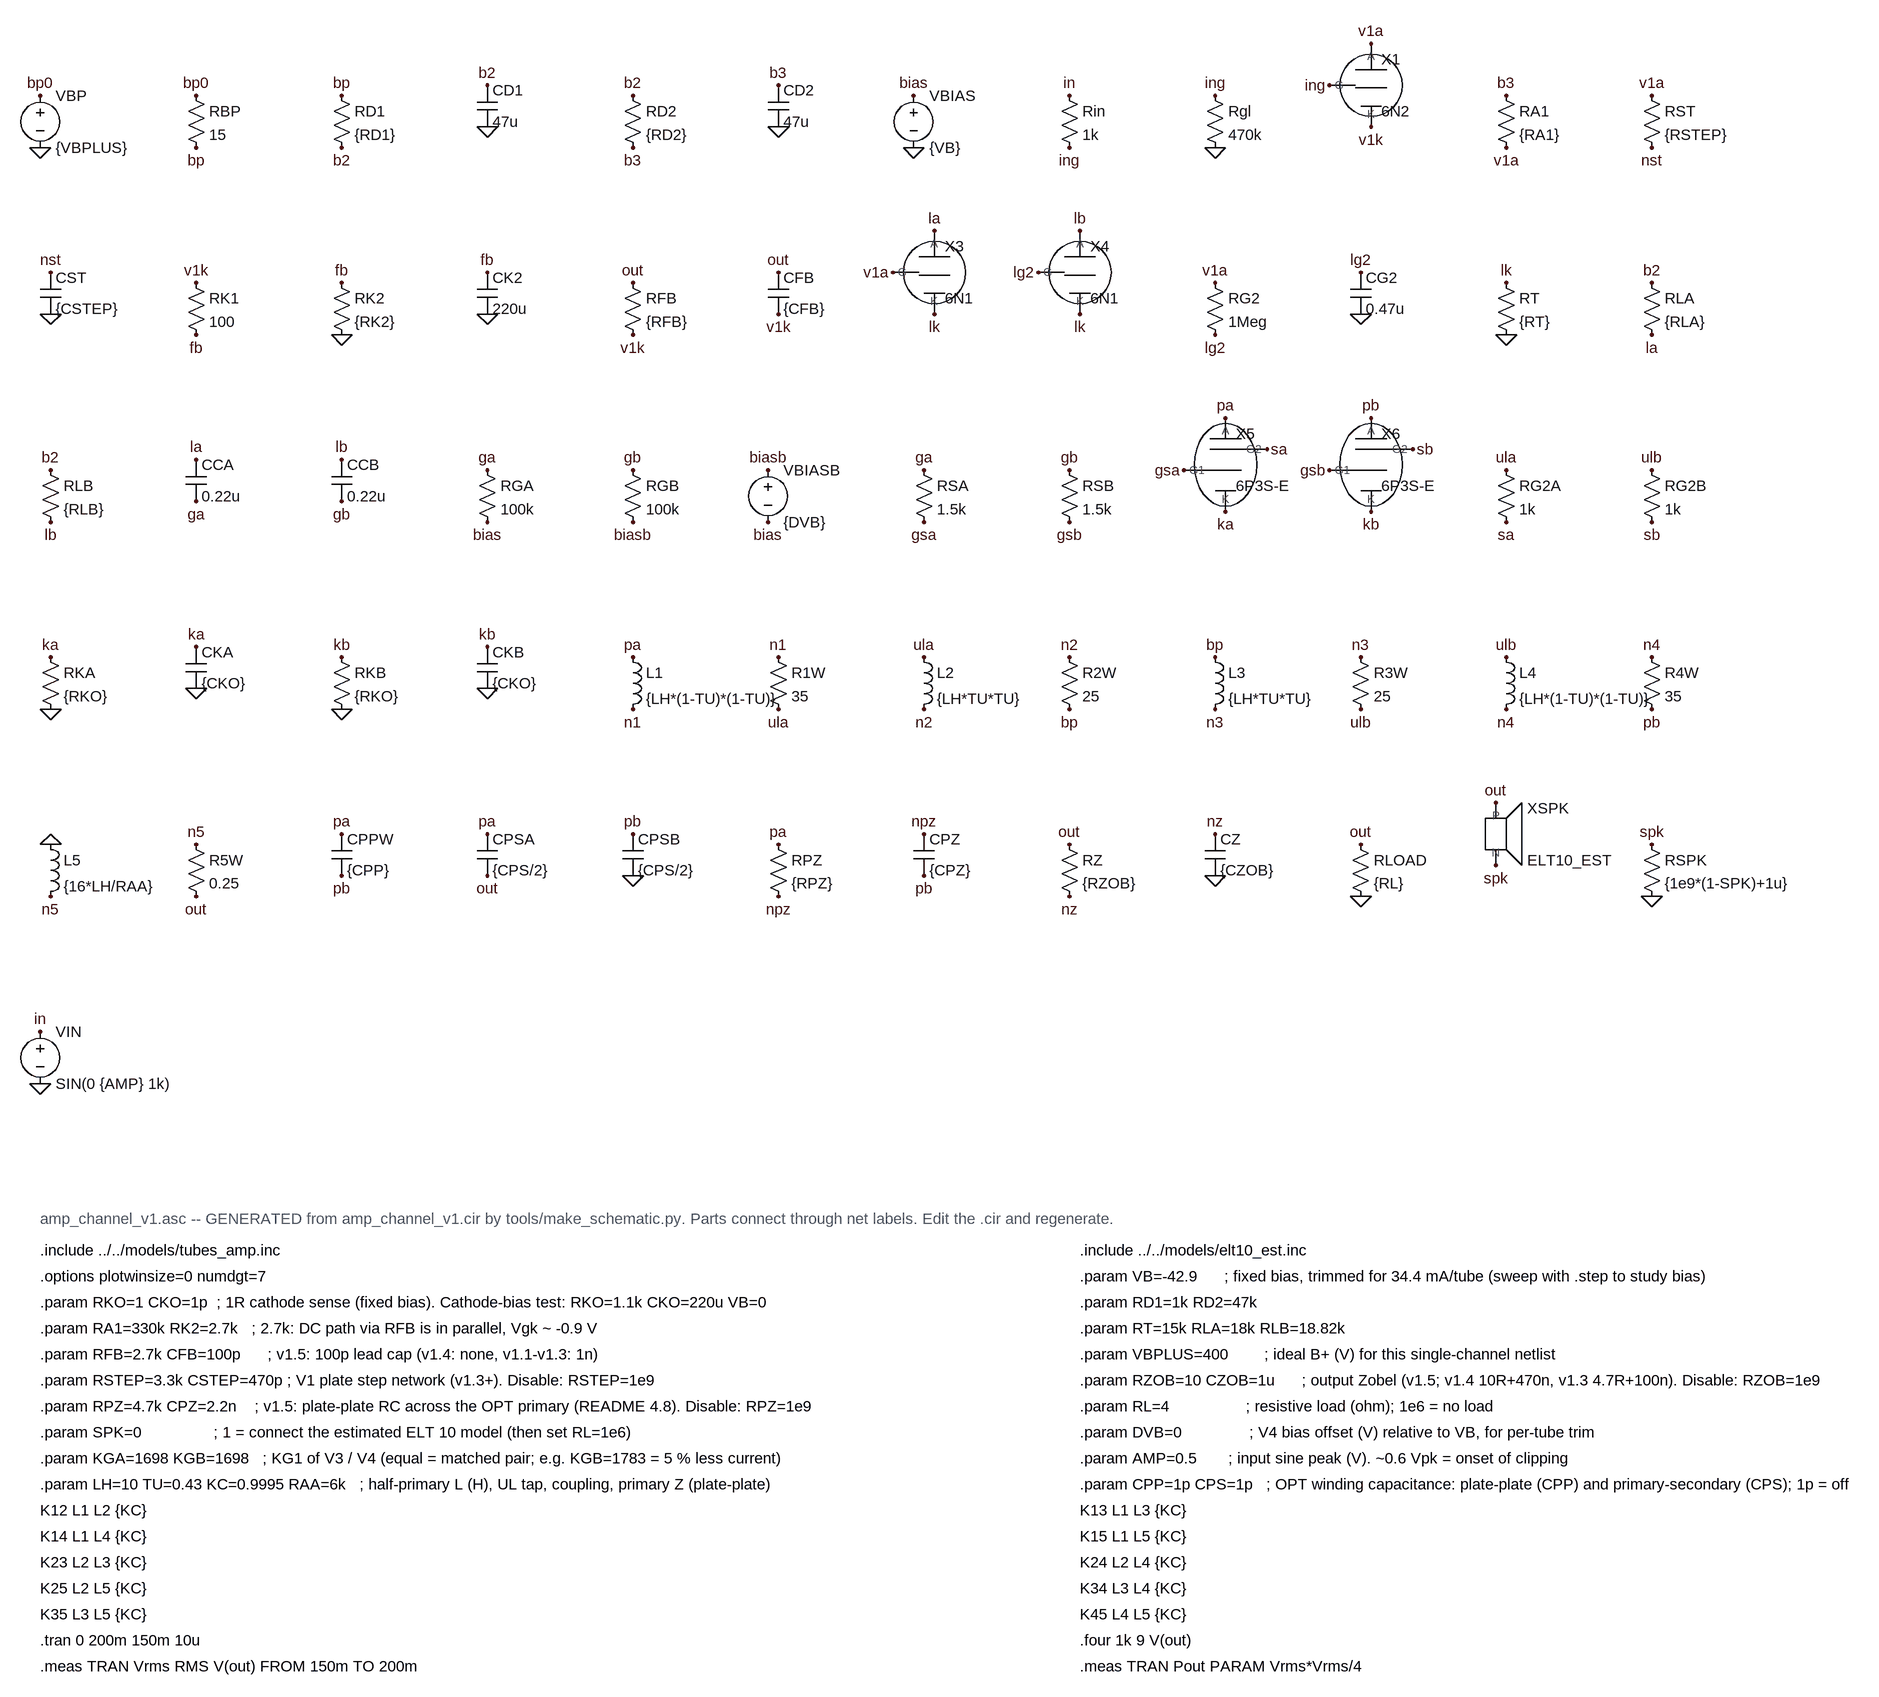
[diagram p0: schematic amp_channel_v1.asc]
amp_channel_v1.asc, the LTspice schematic file:
Version 4
SHEET 1 3200 2400
FLAG 64 112 bp0
FLAG 64 192 0
SYMBOL voltage 64 96 R0
SYMATTR InstName VBP
SYMATTR Value {VBPLUS}
FLAG 304 112 bp0
FLAG 304 192 bp
SYMBOL res 288 96 R0
SYMATTR InstName RBP
SYMATTR Value 15
FLAG 528 112 bp
FLAG 528 192 b2
SYMBOL res 512 96 R0
SYMATTR InstName RD1
SYMATTR Value {RD1}
FLAG 752 96 b2
FLAG 752 160 0
SYMBOL cap 736 96 R0
SYMATTR InstName CD1
SYMATTR Value 47u
FLAG 976 112 b2
FLAG 976 192 b3
SYMBOL res 960 96 R0
SYMATTR InstName RD2
SYMATTR Value {RD2}
FLAG 1200 96 b3
FLAG 1200 160 0
SYMBOL cap 1184 96 R0
SYMATTR InstName CD2
SYMATTR Value 47u
FLAG 1408 112 bias
FLAG 1408 192 0
SYMBOL voltage 1408 96 R0
SYMATTR InstName VBIAS
SYMATTR Value {VB}
FLAG 1648 112 in
FLAG 1648 192 ing
SYMBOL res 1632 96 R0
SYMATTR InstName Rin
SYMATTR Value 1k
FLAG 1872 112 ing
FLAG 1872 192 0
SYMBOL res 1856 96 R0
SYMATTR InstName Rgl
SYMATTR Value 470k
FLAG 2112 32 v1a
FLAG 2048 96 ing
FLAG 2112 160 v1k
SYMBOL mc34b_triode 2080 96 R0
SYMATTR InstName X1
SYMATTR Value 6N2
FLAG 2320 112 b3
FLAG 2320 192 v1a
SYMBOL res 2304 96 R0
SYMATTR InstName RA1
SYMATTR Value {RA1}
FLAG 2544 112 v1a
FLAG 2544 192 nst
SYMBOL res 2528 96 R0
SYMATTR InstName RST
SYMATTR Value {RSTEP}
FLAG 80 384 nst
FLAG 80 448 0
SYMBOL cap 64 384 R0
SYMATTR InstName CST
SYMATTR Value {CSTEP}
FLAG 304 400 v1k
FLAG 304 480 fb
SYMBOL res 288 384 R0
SYMATTR InstName RK1
SYMATTR Value 100
FLAG 528 400 fb
FLAG 528 480 0
SYMBOL res 512 384 R0
SYMATTR InstName RK2
SYMATTR Value {RK2}
FLAG 752 384 fb
FLAG 752 448 0
SYMBOL cap 736 384 R0
SYMATTR InstName CK2
SYMATTR Value 220u
FLAG 976 400 out
FLAG 976 480 v1k
SYMBOL res 960 384 R0
SYMATTR InstName RFB
SYMATTR Value {RFB}
FLAG 1200 384 out
FLAG 1200 448 v1k
SYMBOL cap 1184 384 R0
SYMATTR InstName CFB
SYMATTR Value {CFB}
FLAG 1440 320 la
FLAG 1376 384 v1a
FLAG 1440 448 lk
SYMBOL mc34b_triode 1408 384 R0
SYMATTR InstName X3
SYMATTR Value 6N1
FLAG 1664 320 lb
FLAG 1600 384 lg2
FLAG 1664 448 lk
SYMBOL mc34b_triode 1632 384 R0
SYMATTR InstName X4
SYMATTR Value 6N1
FLAG 1872 400 v1a
FLAG 1872 480 lg2
SYMBOL res 1856 384 R0
SYMATTR InstName RG2
SYMATTR Value 1Meg
FLAG 2096 384 lg2
FLAG 2096 448 0
SYMBOL cap 2080 384 R0
SYMATTR InstName CG2
SYMATTR Value 0.47u
FLAG 2320 400 lk
FLAG 2320 480 0
SYMBOL res 2304 384 R0
SYMATTR InstName RT
SYMATTR Value {RT}
FLAG 2544 400 b2
FLAG 2544 480 la
SYMBOL res 2528 384 R0
SYMATTR InstName RLA
SYMATTR Value {RLA}
FLAG 80 688 b2
FLAG 80 768 lb
SYMBOL res 64 672 R0
SYMATTR InstName RLB
SYMATTR Value {RLB}
FLAG 304 672 la
FLAG 304 736 ga
SYMBOL cap 288 672 R0
SYMATTR InstName CCA
SYMATTR Value 0.22u
FLAG 528 672 lb
FLAG 528 736 gb
SYMBOL cap 512 672 R0
SYMATTR InstName CCB
SYMATTR Value 0.22u
FLAG 752 688 ga
FLAG 752 768 bias
SYMBOL res 736 672 R0
SYMATTR InstName RGA
SYMATTR Value 100k
FLAG 976 688 gb
FLAG 976 768 biasb
SYMBOL res 960 672 R0
SYMATTR InstName RGB
SYMATTR Value 100k
FLAG 1184 688 biasb
FLAG 1184 768 bias
SYMBOL voltage 1184 672 R0
SYMATTR InstName VBIASB
SYMATTR Value {DVB}
FLAG 1424 688 ga
FLAG 1424 768 gsa
SYMBOL res 1408 672 R0
SYMATTR InstName RSA
SYMATTR Value 1.5k
FLAG 1648 688 gb
FLAG 1648 768 gsb
SYMBOL res 1632 672 R0
SYMATTR InstName RSB
SYMATTR Value 1.5k
FLAG 1888 608 pa
FLAG 1952 656 sa
FLAG 1824 688 gsa
FLAG 1888 752 ka
SYMBOL mc34b_pentode 1856 672 R0
SYMATTR InstName X5
SYMATTR Value 6P3S-E
SYMATTR SpiceLine KG1={KGA}
FLAG 2112 608 pb
FLAG 2176 656 sb
FLAG 2048 688 gsb
FLAG 2112 752 kb
SYMBOL mc34b_pentode 2080 672 R0
SYMATTR InstName X6
SYMATTR Value 6P3S-E
SYMATTR SpiceLine KG1={KGB}
FLAG 2320 688 ula
FLAG 2320 768 sa
SYMBOL res 2304 672 R0
SYMATTR InstName RG2A
SYMATTR Value 1k
FLAG 2544 688 ulb
FLAG 2544 768 sb
SYMBOL res 2528 672 R0
SYMATTR InstName RG2B
SYMATTR Value 1k
FLAG 80 976 ka
FLAG 80 1056 0
SYMBOL res 64 960 R0
SYMATTR InstName RKA
SYMATTR Value {RKO}
FLAG 304 960 ka
FLAG 304 1024 0
SYMBOL cap 288 960 R0
SYMATTR InstName CKA
SYMATTR Value {CKO}
FLAG 528 976 kb
FLAG 528 1056 0
SYMBOL res 512 960 R0
SYMATTR InstName RKB
SYMATTR Value {RKO}
FLAG 752 960 kb
FLAG 752 1024 0
SYMBOL cap 736 960 R0
SYMATTR InstName CKB
SYMATTR Value {CKO}
FLAG 976 976 pa
FLAG 976 1056 n1
SYMBOL ind 960 960 R0
SYMATTR InstName L1
SYMATTR Value {LH*(1-TU)*(1-TU)}
FLAG 1200 976 n1
FLAG 1200 1056 ula
SYMBOL res 1184 960 R0
SYMATTR InstName R1W
SYMATTR Value 35
FLAG 1424 976 ula
FLAG 1424 1056 n2
SYMBOL ind 1408 960 R0
SYMATTR InstName L2
SYMATTR Value {LH*TU*TU}
FLAG 1648 976 n2
FLAG 1648 1056 bp
SYMBOL res 1632 960 R0
SYMATTR InstName R2W
SYMATTR Value 25
FLAG 1872 976 bp
FLAG 1872 1056 n3
SYMBOL ind 1856 960 R0
SYMATTR InstName L3
SYMATTR Value {LH*TU*TU}
FLAG 2096 976 n3
FLAG 2096 1056 ulb
SYMBOL res 2080 960 R0
SYMATTR InstName R3W
SYMATTR Value 25
FLAG 2320 976 ulb
FLAG 2320 1056 n4
SYMBOL ind 2304 960 R0
SYMATTR InstName L4
SYMATTR Value {LH*(1-TU)*(1-TU)}
FLAG 2544 976 n4
FLAG 2544 1056 pb
SYMBOL res 2528 960 R0
SYMATTR InstName R4W
SYMATTR Value 35
FLAG 80 1264 0
FLAG 80 1344 n5
SYMBOL ind 64 1248 R0
SYMATTR InstName L5
SYMATTR Value {16*LH/RAA}
FLAG 304 1264 n5
FLAG 304 1344 out
SYMBOL res 288 1248 R0
SYMATTR InstName R5W
SYMATTR Value 0.25
FLAG 528 1248 pa
FLAG 528 1312 pb
SYMBOL cap 512 1248 R0
SYMATTR InstName CPPW
SYMATTR Value {CPP}
FLAG 752 1248 pa
FLAG 752 1312 out
SYMBOL cap 736 1248 R0
SYMATTR InstName CPSA
SYMATTR Value {CPS/2}
FLAG 976 1248 pb
FLAG 976 1312 0
SYMBOL cap 960 1248 R0
SYMATTR InstName CPSB
SYMATTR Value {CPS/2}
FLAG 1200 1264 pa
FLAG 1200 1344 npz
SYMBOL res 1184 1248 R0
SYMATTR InstName RPZ
SYMATTR Value {RPZ}
FLAG 1424 1248 npz
FLAG 1424 1312 pb
SYMBOL cap 1408 1248 R0
SYMATTR InstName CPZ
SYMATTR Value {CPZ}
FLAG 1648 1264 out
FLAG 1648 1344 nz
SYMBOL res 1632 1248 R0
SYMATTR InstName RZ
SYMATTR Value {RZOB}
FLAG 1872 1248 nz
FLAG 1872 1312 0
SYMBOL cap 1856 1248 R0
SYMATTR InstName CZ
SYMATTR Value {CZOB}
FLAG 2096 1264 out
FLAG 2096 1344 0
SYMBOL res 2080 1248 R0
SYMATTR InstName RLOAD
SYMATTR Value {RL}
FLAG 2304 1200 out
FLAG 2304 1296 spk
SYMBOL mc34b_speaker 2304 1248 R0
SYMATTR InstName XSPK
SYMATTR Value ELT10_EST
FLAG 2544 1264 spk
FLAG 2544 1344 0
SYMBOL res 2528 1248 R0
SYMATTR InstName RSPK
SYMATTR Value {1e9*(1-SPK)+1u}
FLAG 64 1552 in
FLAG 64 1632 0
SYMBOL voltage 64 1536 R0
SYMATTR InstName VIN
SYMATTR Value SIN(0 {AMP} 1k)
SYMATTR Value2 AC 1
TEXT 64 1840 Left 2 ;amp_channel_v1.asc -- GENERATED from amp_channel_v1.cir by tools/make_schematic.py. Parts connect through net labels. Edit the .cir and regenerate.
TEXT 64 1888 Left 2 !.include ../../models/tubes_amp.inc
TEXT 1664 1888 Left 2 !.include ../../models/elt10_est.inc
TEXT 64 1928 Left 2 !.options plotwinsize=0 numdgt=7
TEXT 1664 1928 Left 2 !.param VB=-42.9      ; fixed bias, trimmed for 34.4 mA/tube (sweep with .step to study bias)
TEXT 64 1968 Left 2 !.param RKO=1 CKO=1p  ; 1R cathode sense (fixed bias). Cathode-bias test: RKO=1.1k CKO=220u VB=0
TEXT 1664 1968 Left 2 !.param RD1=1k RD2=47k
TEXT 64 2008 Left 2 !.param RA1=330k RK2=2.7k   ; 2.7k: DC path via RFB is in parallel, Vgk ~ -0.9 V
TEXT 1664 2008 Left 2 !.param RT=15k RLA=18k RLB=18.82k
TEXT 64 2048 Left 2 !.param RFB=2.7k CFB=100p      ; v1.5: 100p lead cap (v1.4: none, v1.1-v1.3: 1n)
TEXT 1664 2048 Left 2 !.param VBPLUS=400        ; ideal B+ (V) for this single-channel netlist
TEXT 64 2088 Left 2 !.param RSTEP=3.3k CSTEP=470p ; V1 plate step network (v1.3+). Disable: RSTEP=1e9
TEXT 1664 2088 Left 2 !.param RZOB=10 CZOB=1u      ; output Zobel (v1.5; v1.4 10R+470n, v1.3 4.7R+100n). Disable: RZOB=1e9
TEXT 64 2128 Left 2 !.param RPZ=4.7k CPZ=2.2n    ; v1.5: plate-plate RC across the OPT primary (README 4.8). Disable: RPZ=1e9
TEXT 1664 2128 Left 2 !.param RL=4                 ; resistive load (ohm); 1e6 = no load
TEXT 64 2168 Left 2 !.param SPK=0                ; 1 = connect the estimated ELT 10 model (then set RL=1e6)
TEXT 1664 2168 Left 2 !.param DVB=0               ; V4 bias offset (V) relative to VB, for per-tube trim
TEXT 64 2208 Left 2 !.param KGA=1698 KGB=1698   ; KG1 of V3 / V4 (equal = matched pair; e.g. KGB=1783 = 5 % less current)
TEXT 1664 2208 Left 2 !.param AMP=0.5       ; input sine peak (V). ~0.6 Vpk = onset of clipping
TEXT 64 2248 Left 2 !.param LH=10 TU=0.43 KC=0.9995 RAA=6k   ; half-primary L (H), UL tap, coupling, primary Z (plate-plate)
TEXT 1664 2248 Left 2 !.param CPP=1p CPS=1p   ; OPT winding capacitance: plate-plate (CPP) and primary-secondary (CPS); 1p = off
TEXT 64 2288 Left 2 !K12 L1 L2 {KC}
TEXT 1664 2288 Left 2 !K13 L1 L3 {KC}
TEXT 64 2328 Left 2 !K14 L1 L4 {KC}
TEXT 1664 2328 Left 2 !K15 L1 L5 {KC}
TEXT 64 2368 Left 2 !K23 L2 L3 {KC}
TEXT 1664 2368 Left 2 !K24 L2 L4 {KC}
TEXT 64 2408 Left 2 !K25 L2 L5 {KC}
TEXT 1664 2408 Left 2 !K34 L3 L4 {KC}
TEXT 64 2448 Left 2 !K35 L3 L5 {KC}
TEXT 1664 2448 Left 2 !K45 L4 L5 {KC}
TEXT 64 2488 Left 2 !.tran 0 200m 150m 10u
TEXT 1664 2488 Left 2 !.four 1k 9 V(out)
TEXT 64 2528 Left 2 !.meas TRAN Vrms RMS V(out) FROM 150m TO 200m
TEXT 1664 2528 Left 2 !.meas TRAN Pout PARAM Vrms*Vrms/4

The netlist it stands for:
* amp_channel_v1.asc
VBP bp0 0 {VBPLUS}
RBP bp0 bp 15
RD1 bp b2 {RD1}
CD1 b2 0 47u
RD2 b2 b3 {RD2}
CD2 b3 0 47u
VBIAS bias 0 {VB}
Rin in ing 1k
Rgl ing 0 470k
XX1 v1a ing v1k 6N2  ; pins A G K
RA1 b3 v1a {RA1}
RST v1a nst {RSTEP}
CST nst 0 {CSTEP}
RK1 v1k fb 100
RK2 fb 0 {RK2}
CK2 fb 0 220u
RFB out v1k {RFB}
CFB out v1k {CFB}
XX3 la v1a lk 6N1  ; pins A G K
XX4 lb lg2 lk 6N1  ; pins A G K
RG2 v1a lg2 1Meg
CG2 lg2 0 0.47u
RT lk 0 {RT}
RLA b2 la {RLA}
RLB b2 lb {RLB}
CCA la ga 0.22u
CCB lb gb 0.22u
RGA ga bias 100k
RGB gb biasb 100k
VBIASB biasb bias {DVB}
RSA ga gsa 1.5k
RSB gb gsb 1.5k
XX5 pa sa gsa ka 6P3S-E KG1={KGA}  ; pins A G2 G1 K
XX6 pb sb gsb kb 6P3S-E KG1={KGB}  ; pins A G2 G1 K
RG2A ula sa 1k
RG2B ulb sb 1k
RKA ka 0 {RKO}
CKA ka 0 {CKO}
RKB kb 0 {RKO}
CKB kb 0 {CKO}
L1 pa n1 {LH*(1-TU)*(1-TU)}
R1W n1 ula 35
L2 ula n2 {LH*TU*TU}
R2W n2 bp 25
L3 bp n3 {LH*TU*TU}
R3W n3 ulb 25
L4 ulb n4 {LH*(1-TU)*(1-TU)}
R4W n4 pb 35
L5 0 n5 {16*LH/RAA}
R5W n5 out 0.25
CPPW pa pb {CPP}
CPSA pa out {CPS/2}
CPSB pb 0 {CPS/2}
RPZ pa npz {RPZ}
CPZ npz pb {CPZ}
RZ out nz {RZOB}
CZ nz 0 {CZOB}
RLOAD out 0 {RL}
XXSPK out spk ELT10_EST  ; pins P N
RSPK spk 0 {1e9*(1-SPK)+1u}
VIN in 0 SIN(0 {AMP} 1k) AC 1
* amp_channel_v1.asc -- GENERATED from amp_channel_v1.cir by tools/make_schematic.py. Parts connect through net labels. Edit the .cir and regenerate.
.include ../../models/tubes_amp.inc
.include ../../models/elt10_est.inc
.options plotwinsize=0 numdgt=7
.param VB=-42.9      ; fixed bias, trimmed for 34.4 mA/tube (sweep with .step to study bias)
.param RKO=1 CKO=1p  ; 1R cathode sense (fixed bias). Cathode-bias test: RKO=1.1k CKO=220u VB=0
.param RD1=1k RD2=47k
.param RA1=330k RK2=2.7k   ; 2.7k: DC path via RFB is in parallel, Vgk ~ -0.9 V
.param RT=15k RLA=18k RLB=18.82k
.param RFB=2.7k CFB=100p      ; v1.5: 100p lead cap (v1.4: none, v1.1-v1.3: 1n)
.param VBPLUS=400        ; ideal B+ (V) for this single-channel netlist
.param RSTEP=3.3k CSTEP=470p ; V1 plate step network (v1.3+). Disable: RSTEP=1e9
.param RZOB=10 CZOB=1u      ; output Zobel (v1.5; v1.4 10R+470n, v1.3 4.7R+100n). Disable: RZOB=1e9
.param RPZ=4.7k CPZ=2.2n    ; v1.5: plate-plate RC across the OPT primary (README 4.8). Disable: RPZ=1e9
.param RL=4                 ; resistive load (ohm); 1e6 = no load
.param SPK=0                ; 1 = connect the estimated ELT 10 model (then set RL=1e6)
.param DVB=0               ; V4 bias offset (V) relative to VB, for per-tube trim
.param KGA=1698 KGB=1698   ; KG1 of V3 / V4 (equal = matched pair; e.g. KGB=1783 = 5 % less current)
.param AMP=0.5       ; input sine peak (V). ~0.6 Vpk = onset of clipping
.param LH=10 TU=0.43 KC=0.9995 RAA=6k   ; half-primary L (H), UL tap, coupling, primary Z (plate-plate)
.param CPP=1p CPS=1p   ; OPT winding capacitance: plate-plate (CPP) and primary-secondary (CPS); 1p = off
K12 L1 L2 {KC}
K13 L1 L3 {KC}
K14 L1 L4 {KC}
K15 L1 L5 {KC}
K23 L2 L3 {KC}
K24 L2 L4 {KC}
K25 L2 L5 {KC}
K34 L3 L4 {KC}
K35 L3 L5 {KC}
K45 L4 L5 {KC}
.tran 0 200m 150m 10u
.four 1k 9 V(out)
.meas TRAN Vrms RMS V(out) FROM 150m TO 200m
.meas TRAN Pout PARAM Vrms*Vrms/4
.backanno
.end